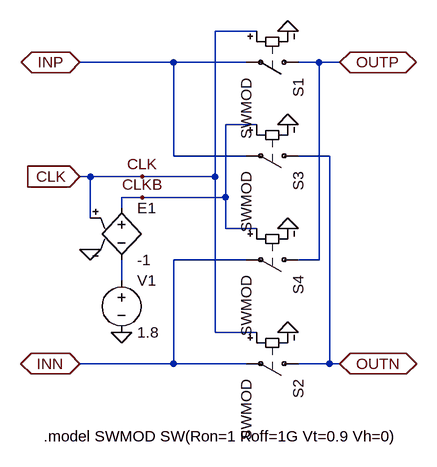
[diagram p0: schematic SWch.asc]
SWch.asc, the LTspice schematic file:
Version 4
SHEET 1 880 680
WIRE 192 -176 128 -176
WIRE 64 -128 -80 -128
WIRE 176 -128 64 -128
WIRE 288 -128 256 -128
WIRE 320 -128 288 -128
WIRE 192 -32 144 -32
WIRE 64 16 64 -128
WIRE 176 16 64 16
WIRE 304 16 256 16
WIRE -64 48 -80 48
WIRE 16 48 -64 48
WIRE 128 48 128 -176
WIRE 128 48 16 48
WIRE 16 80 -16 80
WIRE 144 80 144 -32
WIRE 144 80 16 80
WIRE -16 96 -16 80
WIRE -64 112 -64 48
WIRE 144 128 144 80
WIRE 192 128 144 128
WIRE 176 176 64 176
WIRE 288 176 288 -128
WIRE 288 176 256 176
WIRE -16 208 -16 176
WIRE 128 288 128 48
WIRE 192 288 128 288
WIRE 64 336 64 176
WIRE 64 336 -80 336
WIRE 176 336 64 336
WIRE 304 336 304 16
WIRE 304 336 256 336
WIRE 320 336 304 336
FLAG 240 -176 0
FLAG 240 288 0
FLAG 240 -32 0
FLAG -80 48 CLK
IOPIN -80 48 In
FLAG -80 -128 INP
IOPIN -80 -128 BiDir
FLAG -80 336 INN
IOPIN -80 336 BiDir
FLAG 320 -128 OUTP
IOPIN 320 -128 BiDir
FLAG 240 128 0
FLAG 320 336 OUTN
IOPIN 320 336 BiDir
FLAG -64 160 0
FLAG -16 288 0
FLAG 16 80 CLKB
FLAG 16 48 CLK
SYMBOL sw 272 -128 R90
SYMATTR InstName S1
SYMATTR Value SWMOD
SYMBOL sw 272 336 R90
SYMATTR InstName S2
SYMATTR Value SWMOD
SYMBOL sw 272 16 R90
SYMATTR InstName S3
SYMATTR Value SWMOD
SYMBOL sw 272 176 R90
SYMATTR InstName S4
SYMATTR Value SWMOD
SYMBOL e -16 80 R0
SYMATTR InstName E1
SYMATTR Value -1
SYMBOL voltage -16 192 R0
SYMATTR InstName V1
SYMATTR Value 1.8
TEXT -136 448 Left 2 !.model SWMOD SW(Ron=1 Roff=1G Vt=0.9 Vh=0)

The netlist it stands for:
* SWch.asc
S1 OUTP INP CLK 0 SWMOD
S2 OUTN INN CLK 0 SWMOD
S3 OUTN INP CLKB 0 SWMOD
S4 OUTP INN CLKB 0 SWMOD
E1 CLKB N001 CLK 0 -1
V1 N001 0 1.8
.model SWMOD SW(Ron=1 Roff=1G Vt=0.9 Vh=0)
.backanno
.end